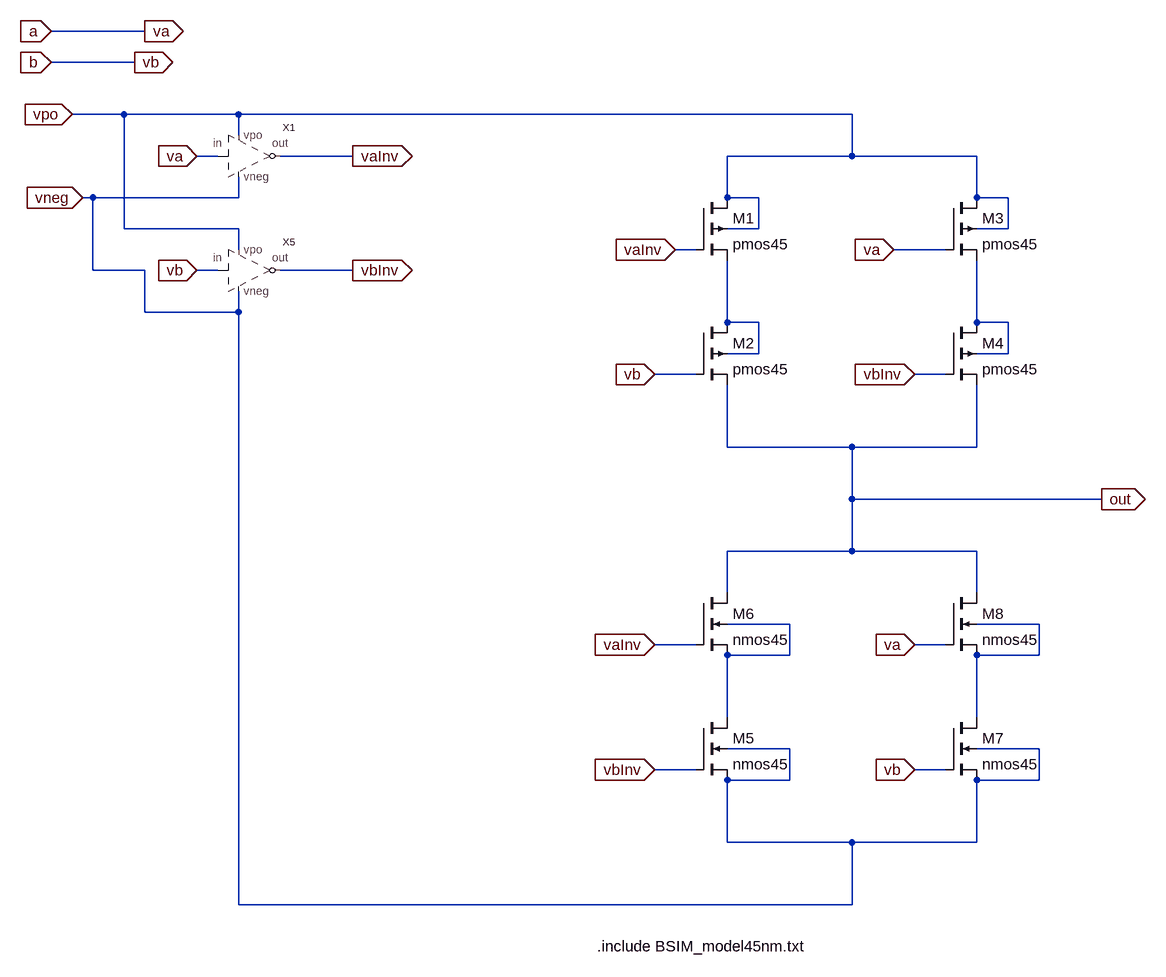
[diagram p0: schematic XOR.asc]
XOR.asc, the LTspice schematic file:
Version 4
SHEET 1 884 1360
WIRE -672 -80 -816 -80
WIRE -688 -32 -816 -32
WIRE -704 48 -784 48
WIRE -528 48 -704 48
WIRE 416 48 -528 48
WIRE -528 80 -528 48
WIRE -560 112 -592 112
WIRE -352 112 -464 112
WIRE 416 112 416 48
WIRE 416 112 224 112
WIRE 608 112 416 112
WIRE -752 176 -768 176
WIRE -528 176 -528 144
WIRE -528 176 -752 176
WIRE 224 176 224 112
WIRE 272 176 224 176
WIRE 608 176 608 112
WIRE 656 176 608 176
WIRE -704 224 -704 48
WIRE -528 224 -704 224
WIRE 272 224 272 176
WIRE 272 224 224 224
WIRE 656 224 656 176
WIRE 656 224 608 224
WIRE -528 256 -528 224
WIRE 176 256 144 256
WIRE 560 256 480 256
WIRE -752 288 -752 176
WIRE -672 288 -752 288
WIRE -560 288 -592 288
WIRE -352 288 -464 288
WIRE -672 352 -672 288
WIRE -528 352 -528 320
WIRE -528 352 -672 352
WIRE 224 368 224 272
WIRE 272 368 224 368
WIRE 608 368 608 272
WIRE 656 368 608 368
WIRE 272 416 272 368
WIRE 272 416 224 416
WIRE 656 416 656 368
WIRE 656 416 608 416
WIRE 176 448 112 448
WIRE 560 448 512 448
WIRE 224 560 224 464
WIRE 416 560 224 560
WIRE 608 560 608 464
WIRE 608 560 416 560
WIRE 416 640 416 560
WIRE 800 640 416 640
WIRE 416 720 416 640
WIRE 416 720 224 720
WIRE 608 720 416 720
WIRE 224 784 224 720
WIRE 608 784 608 720
WIRE 320 832 224 832
WIRE 704 832 608 832
WIRE 176 864 112 864
WIRE 560 864 512 864
WIRE 320 880 320 832
WIRE 320 880 224 880
WIRE 704 880 704 832
WIRE 704 880 608 880
WIRE 224 976 224 880
WIRE 608 976 608 880
WIRE 320 1024 224 1024
WIRE 704 1024 608 1024
WIRE 176 1056 112 1056
WIRE 560 1056 512 1056
WIRE 320 1072 320 1024
WIRE 320 1072 224 1072
WIRE 704 1072 704 1024
WIRE 704 1072 608 1072
WIRE 224 1168 224 1072
WIRE 416 1168 224 1168
WIRE 608 1168 608 1072
WIRE 608 1168 416 1168
WIRE -528 1264 -528 352
WIRE 416 1264 416 1168
WIRE 416 1264 -528 1264
FLAG -816 -32 b
IOPIN -816 -32 In
FLAG 800 640 out
IOPIN 800 640 Out
FLAG -784 48 vpo
IOPIN -784 48 In
FLAG -816 -80 a
IOPIN -816 -80 In
FLAG -768 176 vneg
IOPIN -768 176 In
FLAG -352 288 vbInv
IOPIN -352 288 Out
FLAG -352 112 vaInv
IOPIN -352 112 Out
FLAG 144 256 vaInv
IOPIN 144 256 In
FLAG 512 864 va
IOPIN 512 864 In
FLAG 512 448 vbInv
IOPIN 512 448 In
FLAG 512 1056 vb
IOPIN 512 1056 In
FLAG 112 1056 vbInv
IOPIN 112 1056 In
FLAG 112 864 vaInv
IOPIN 112 864 In
FLAG 112 448 vb
IOPIN 112 448 In
FLAG -672 -80 va
IOPIN -672 -80 Out
FLAG -688 -32 vb
IOPIN -688 -32 Out
FLAG 480 256 va
IOPIN 480 256 In
FLAG -592 112 va
IOPIN -592 112 In
FLAG -592 288 vb
IOPIN -592 288 In
SYMBOL pmos4 176 176 R0
SYMATTR InstName M1
SYMATTR Value pmos45
SYMATTR Value2 l=60nm w=400nm
SYMBOL pmos4 176 368 R0
SYMATTR InstName M2
SYMATTR Value pmos45
SYMATTR Value2 l=60nm w=400nm
SYMBOL pmos4 560 176 R0
SYMATTR InstName M3
SYMATTR Value pmos45
SYMATTR Value2 l=60nm w=400nm
SYMBOL pmos4 560 368 R0
SYMATTR InstName M4
SYMATTR Value pmos45
SYMATTR Value2 l=60nm w=400nm
SYMBOL Inverter -528 112 R0
SYMATTR InstName X1
SYMBOL nmos4 176 976 R0
SYMATTR InstName M5
SYMATTR Value nmos45
SYMATTR Value2 l=60nm w=200nm
SYMBOL nmos4 176 784 R0
SYMATTR InstName M6
SYMATTR Value nmos45
SYMATTR Value2 l=60nm w=200nm
SYMBOL nmos4 560 976 R0
SYMATTR InstName M7
SYMATTR Value nmos45
SYMATTR Value2 l=60nm w=200nm
SYMBOL nmos4 560 784 R0
SYMATTR InstName M8
SYMATTR Value nmos45
SYMATTR Value2 l=60nm w=200nm
SYMBOL Inverter -528 288 R0
SYMATTR InstName X5
TEXT 24 1328 Left 2 !.include BSIM_model45nm.txt

The netlist it stands for:
* XOR.asc
M1 vpo vaInv N001 vpo pmos45 l=60nm w=400nm
M2 N001 vb out N001 pmos45 l=60nm w=400nm
M3 vpo va N002 vpo pmos45 l=60nm w=400nm
M4 N002 vbInv out N002 pmos45 l=60nm w=400nm
XX1 va vaInv vpo vneg Inverter  ; pins in out vpo vneg
M5 N003 vbInv vneg vneg nmos45 l=60nm w=200nm
M6 out vaInv N003 N003 nmos45 l=60nm w=200nm
M7 N004 vb vneg vneg nmos45 l=60nm w=200nm
M8 out va N004 N004 nmos45 l=60nm w=200nm
XX5 vb vbInv vpo vneg Inverter  ; pins in out vpo vneg
.model NMOS NMOS
.model PMOS PMOS
.lib standard.mos
.include BSIM_model45nm.txt
.backanno
.end